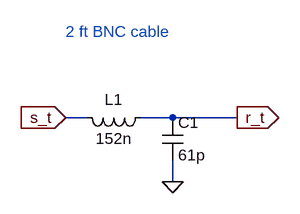
[diagram p0: schematic BNC_Cable.asc]
BNC_Cable.asc, the LTspice schematic file:
Version 4.1
SHEET 1 880 680
WIRE -64 0 -96 0
WIRE 160 0 16 0
WIRE 64 96 64 64
FLAG -96 0 s_t
IOPIN -96 0 In
FLAG 160 0 r_t
IOPIN 160 0 Out
FLAG 64 96 0
SYMBOL ind 32 -16 R90
WINDOW 0 5 56 VBottom 2
WINDOW 3 32 56 VTop 2
SYMATTR InstName L1
SYMATTR Value 152n
SYMBOL cap 48 0 R0
SYMATTR InstName C1
SYMATTR Value 61p
TEXT -96 -128 Left 2 ;2 ft BNC cable

The netlist it stands for:
* BNC_Cable.asc
L1 r_t s_t 152n
C1 r_t 0 61p
* 2 ft BNC cable
.backanno
.end